# Altium schematic sheet IDC_Tester_v1_connector.SchDoc
size A4; SheetNumber: 3; SheetTotal: 10
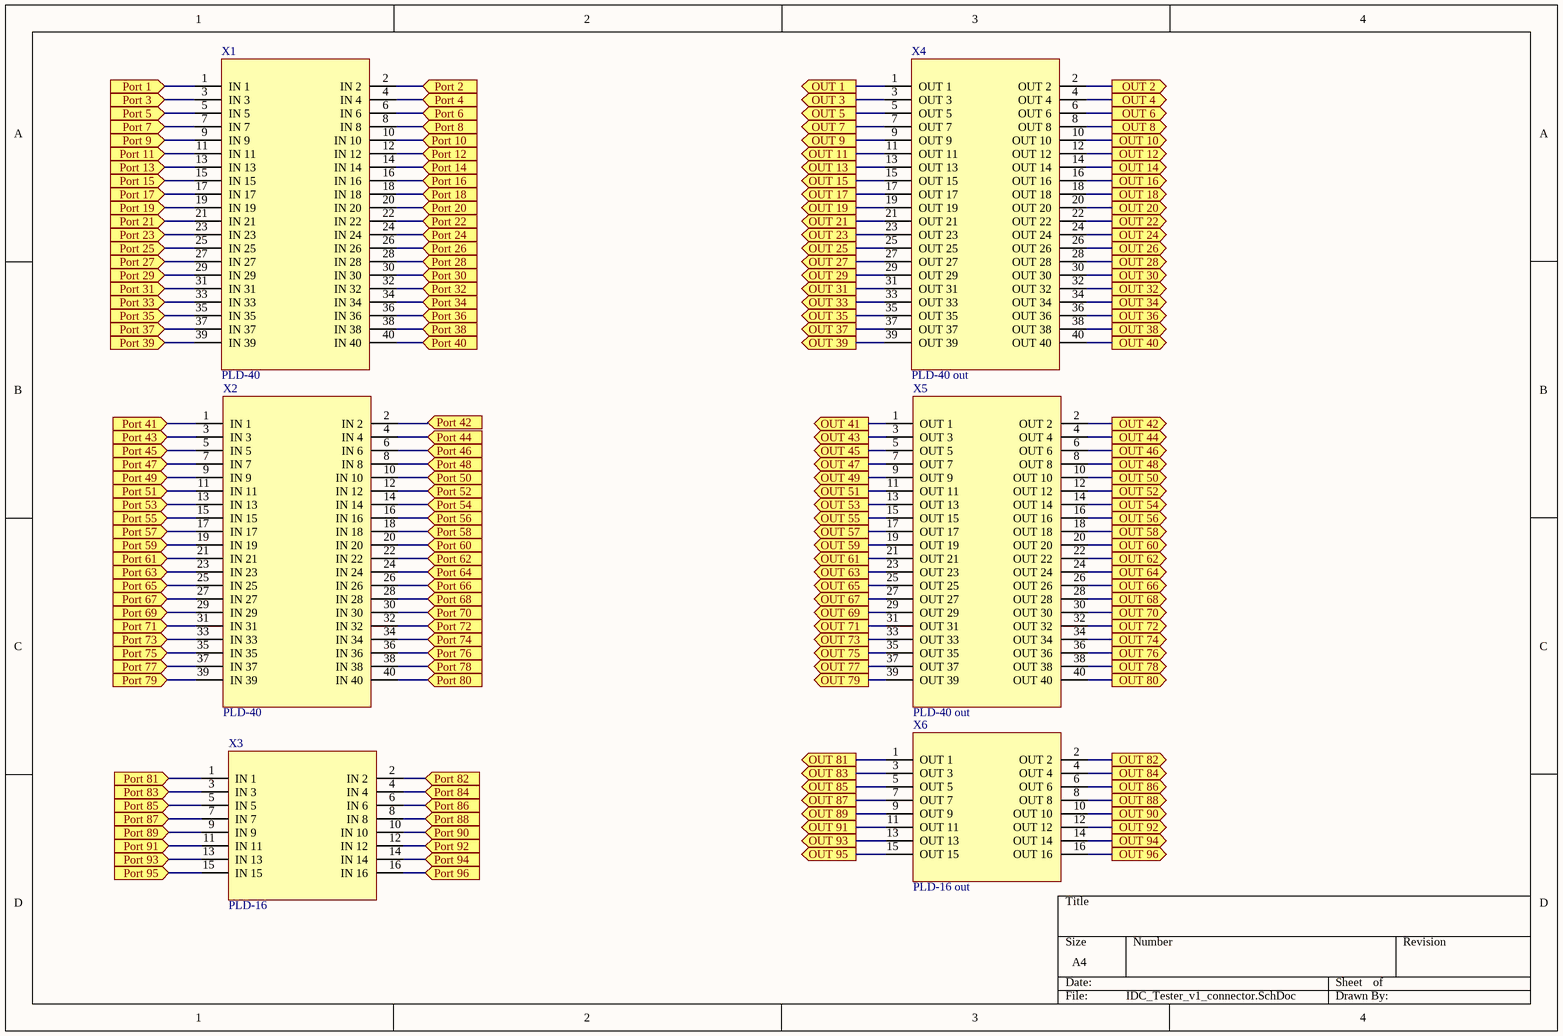
[diagram p0: IDC_Tester_v1_connector.SchDoc]

## Parts
X1  PLD-40  [PLD-40]
X2  PLD-40  [PLD-40]
X3  PLD-16  [PLD-16]
X4  PLD-40 out  [PLD-40]
X5  PLD-40 out  [PLD-40]
X6  PLD-16 out  [PLD-16]

## Ports
OUT 1 (out), OUT 2 (out), OUT 3 (out), OUT 4 (out), OUT 5 (out), OUT 6 (out), OUT 7 (out), OUT 8 (out), OUT 9 (out), OUT 10 (out), OUT 11 (out), OUT 12 (out), OUT 13 (out), OUT 14 (out), OUT 15 (out), OUT 16 (out), OUT 17 (out), OUT 18 (out), OUT 19 (out), OUT 20 (out), OUT 21 (out), OUT 22 (out), OUT 23 (out), OUT 24 (out), OUT 25 (out), OUT 26 (out), OUT 27 (out), OUT 28 (out), OUT 29 (out), OUT 30 (out), OUT 31 (out), OUT 32 (out), OUT 33 (out), OUT 34 (out), OUT 35 (out), OUT 36 (out), OUT 37 (out), OUT 38 (out), OUT 39 (out), OUT 40 (out), OUT 41 (out), OUT 42 (out), OUT 43 (out), OUT 44 (out), OUT 45 (out), OUT 46 (out), OUT 47 (out), OUT 48 (out), OUT 49 (out), OUT 50 (out), OUT 51 (out), OUT 52 (out), OUT 53 (out), OUT 54 (out), OUT 55 (out), OUT 56 (out), OUT 57 (out), OUT 58 (out), OUT 59 (out), OUT 60 (out), OUT 61 (out), OUT 62 (out), OUT 63 (out), OUT 64 (out), OUT 65 (out), OUT 66 (out), OUT 67 (out), OUT 68 (out), OUT 69 (out), OUT 70 (out), OUT 71 (out), OUT 72 (out), OUT 73 (out), OUT 74 (out), OUT 75 (out), OUT 76 (out), OUT 77 (out), OUT 78 (out), OUT 79 (out), OUT 80 (out), OUT 81 (out), OUT 82 (out), OUT 83 (out), OUT 84 (out), OUT 85 (out), OUT 86 (out), OUT 87 (out), OUT 88 (out), OUT 89 (out), OUT 90 (out), OUT 91 (out), OUT 92 (out), OUT 93 (out), OUT 94 (out), OUT 95 (out), OUT 96 (out), Port 1 (in), Port 2 (in), Port 3 (in), Port 4 (in), Port 5 (in), Port 6 (in), Port 7 (in), Port 8 (in), Port 9 (in), Port 10 (in), Port 11 (in), Port 12 (in), Port 13 (in), Port 14 (in), Port 15 (in), Port 16 (in), Port 17 (in), Port 18 (in), Port 19 (in), Port 20 (in), Port 21 (in), Port 22 (in), Port 23 (in), Port 24 (in), Port 25 (in), Port 26 (in), Port 27 (in), Port 28 (in), Port 29 (in), Port 30 (in), Port 31 (in), Port 32 (in), Port 33 (in), Port 34 (in), Port 35 (in), Port 36 (in), Port 37 (in), Port 38 (in), Port 39 (in), Port 40 (in), Port 41 (in), Port 42 (in), Port 43 (in), Port 44 (in), Port 45 (in), Port 46 (in), Port 47 (in), Port 48 (in), Port 49 (in), Port 50 (in), Port 51 (in), Port 52 (in), Port 53 (in), Port 54 (in), Port 55 (in), Port 56 (in), Port 57 (in), Port 58 (in), Port 59 (in), Port 60 (in), Port 61 (in), Port 62 (in), Port 63 (in), Port 64 (in), Port 65 (in), Port 66 (in), Port 67 (in), Port 68 (in), Port 69 (in), Port 70 (in), Port 71 (in), Port 72 (in), Port 73 (in), Port 74 (in), Port 75 (in), Port 76 (in), Port 77 (in), Port 78 (in), Port 79 (in), Port 80 (in), Port 81 (in), Port 82 (in), Port 83 (in), Port 84 (in), Port 85 (in), Port 86 (in), Port 87 (in), Port 88 (in), Port 89 (in), Port 90 (in), Port 91 (in), Port 92 (in), Port 93 (in), Port 94 (in), Port 95 (in), Port 96 (in)

## Nets
OUT 1: X4.1(OUT_1) ; port OUT 1
OUT 2: X4.2(OUT_2) ; port OUT 2
OUT 3: X4.3(OUT_3) ; port OUT 3
OUT 4: X4.4(OUT_4) ; port OUT 4
OUT 5: X4.5(OUT_5) ; port OUT 5
OUT 6: X4.6(OUT_6) ; port OUT 6
OUT 7: X4.7(OUT_7) ; port OUT 7
OUT 8: X4.8(OUT_8) ; port OUT 8
OUT 9: X4.9(OUT_9) ; port OUT 9
OUT 10: X4.10(OUT_10) ; port OUT 10
OUT 11: X4.11(OUT_11) ; port OUT 11
OUT 12: X4.12(OUT_12) ; port OUT 12
OUT 13: X4.13(OUT_13) ; port OUT 13
OUT 14: X4.14(OUT_14) ; port OUT 14
OUT 15: X4.15(OUT_15) ; port OUT 15
OUT 16: X4.16(OUT_16) ; port OUT 16
OUT 17: X4.17(OUT_17) ; port OUT 17
OUT 18: X4.18(OUT_18) ; port OUT 18
OUT 19: X4.19(OUT_19) ; port OUT 19
OUT 20: X4.20(OUT_20) ; port OUT 20
OUT 21: X4.21(OUT_21) ; port OUT 21
OUT 22: X4.22(OUT_22) ; port OUT 22
OUT 23: X4.23(OUT_23) ; port OUT 23
OUT 24: X4.24(OUT_24) ; port OUT 24
OUT 25: X4.25(OUT_25) ; port OUT 25
OUT 26: X4.26(OUT_26) ; port OUT 26
OUT 27: X4.27(OUT_27) ; port OUT 27
OUT 28: X4.28(OUT_28) ; port OUT 28
OUT 29: X4.29(OUT_29) ; port OUT 29
OUT 30: X4.30(OUT_30) ; port OUT 30
OUT 31: X4.31(OUT_31) ; port OUT 31
OUT 32: X4.32(OUT_32) ; port OUT 32
OUT 33: X4.33(OUT_33) ; port OUT 33
OUT 34: X4.34(OUT_34) ; port OUT 34
OUT 35: X4.35(OUT_35) ; port OUT 35
OUT 36: X4.36(OUT_36) ; port OUT 36
OUT 37: X4.37(OUT_37) ; port OUT 37
OUT 38: X4.38(OUT_38) ; port OUT 38
OUT 39: X4.39(OUT_39) ; port OUT 39
OUT 40: X4.40(OUT_40) ; port OUT 40
OUT 41: X5.1(OUT_1) ; port OUT 41
OUT 42: X5.2(OUT_2) ; port OUT 42
OUT 43: X5.3(OUT_3) ; port OUT 43
OUT 44: X5.4(OUT_4) ; port OUT 44
OUT 45: X5.5(OUT_5) ; port OUT 45
OUT 46: X5.6(OUT_6) ; port OUT 46
OUT 47: X5.7(OUT_7) ; port OUT 47
OUT 48: X5.8(OUT_8) ; port OUT 48
OUT 49: X5.9(OUT_9) ; port OUT 49
OUT 50: X5.10(OUT_10) ; port OUT 50
OUT 51: X5.11(OUT_11) ; port OUT 51
OUT 52: X5.12(OUT_12) ; port OUT 52
OUT 53: X5.13(OUT_13) ; port OUT 53
OUT 54: X5.14(OUT_14) ; port OUT 54
OUT 55: X5.15(OUT_15) ; port OUT 55
OUT 56: X5.16(OUT_16) ; port OUT 56
OUT 57: X5.17(OUT_17) ; port OUT 57
OUT 58: X5.18(OUT_18) ; port OUT 58
OUT 59: X5.19(OUT_19) ; port OUT 59
OUT 60: X5.20(OUT_20) ; port OUT 60
OUT 61: X5.21(OUT_21) ; port OUT 61
OUT 62: X5.22(OUT_22) ; port OUT 62
OUT 63: X5.23(OUT_23) ; port OUT 63
OUT 64: X5.24(OUT_24) ; port OUT 64
OUT 65: X5.25(OUT_25) ; port OUT 65
OUT 66: X5.26(OUT_26) ; port OUT 66
OUT 67: X5.27(OUT_27) ; port OUT 67
OUT 68: X5.28(OUT_28) ; port OUT 68
OUT 69: X5.29(OUT_29) ; port OUT 69
OUT 70: X5.30(OUT_30) ; port OUT 70
OUT 71: X5.31(OUT_31) ; port OUT 71
OUT 72: X5.32(OUT_32) ; port OUT 72
OUT 73: X5.33(OUT_33) ; port OUT 73
OUT 74: X5.34(OUT_34) ; port OUT 74
OUT 75: X5.35(OUT_35) ; port OUT 75
OUT 76: X5.36(OUT_36) ; port OUT 76
OUT 77: X5.37(OUT_37) ; port OUT 77
OUT 78: X5.38(OUT_38) ; port OUT 78
OUT 79: X5.39(OUT_39) ; port OUT 79
OUT 80: X5.40(OUT_40) ; port OUT 80
OUT 81: X6.1(OUT_1) ; port OUT 81
OUT 82: X6.2(OUT_2) ; port OUT 82
OUT 83: X6.3(OUT_3) ; port OUT 83
OUT 84: X6.4(OUT_4) ; port OUT 84
OUT 85: X6.5(OUT_5) ; port OUT 85
OUT 86: X6.6(OUT_6) ; port OUT 86
OUT 87: X6.7(OUT_7) ; port OUT 87
OUT 88: X6.8(OUT_8) ; port OUT 88
OUT 89: X6.9(OUT_9) ; port OUT 89
OUT 90: X6.10(OUT_10) ; port OUT 90
OUT 91: X6.11(OUT_11) ; port OUT 91
OUT 92: X6.12(OUT_12) ; port OUT 92
OUT 93: X6.13(OUT_13) ; port OUT 93
OUT 94: X6.14(OUT_14) ; port OUT 94
OUT 95: X6.15(OUT_15) ; port OUT 95
OUT 96: X6.16(OUT_16) ; port OUT 96
Port 1: X1.1(IN_1) ; port Port 1
Port 2: X1.2(IN_2) ; port Port 2
Port 3: X1.3(IN_3) ; port Port 3
Port 4: X1.4(IN_4) ; port Port 4
Port 5: X1.5(IN_5) ; port Port 5
Port 6: X1.6(IN_6) ; port Port 6
Port 7: X1.7(IN_7) ; port Port 7
Port 8: X1.8(IN_8) ; port Port 8
Port 9: X1.9(IN_9) ; port Port 9
Port 10: X1.10(IN_10) ; port Port 10
Port 11: X1.11(IN_11) ; port Port 11
Port 12: X1.12(IN_12) ; port Port 12
Port 13: X1.13(IN_13) ; port Port 13
Port 14: X1.14(IN_14) ; port Port 14
Port 15: X1.15(IN_15) ; port Port 15
Port 16: X1.16(IN_16) ; port Port 16
Port 17: X1.17(IN_17) ; port Port 17
Port 18: X1.18(IN_18) ; port Port 18
Port 19: X1.19(IN_19) ; port Port 19
Port 20: X1.20(IN_20) ; port Port 20
Port 21: X1.21(IN_21) ; port Port 21
Port 22: X1.22(IN_22) ; port Port 22
Port 23: X1.23(IN_23) ; port Port 23
Port 24: X1.24(IN_24) ; port Port 24
Port 25: X1.25(IN_25) ; port Port 25
Port 26: X1.26(IN_26) ; port Port 26
Port 27: X1.27(IN_27) ; port Port 27
Port 28: X1.28(IN_28) ; port Port 28
Port 29: X1.29(IN_29) ; port Port 29
Port 30: X1.30(IN_30) ; port Port 30
Port 31: X1.31(IN_31) ; port Port 31
Port 32: X1.32(IN_32) ; port Port 32
Port 33: X1.33(IN_33) ; port Port 33
Port 34: X1.34(IN_34) ; port Port 34
Port 35: X1.35(IN_35) ; port Port 35
Port 36: X1.36(IN_36) ; port Port 36
Port 37: X1.37(IN_37) ; port Port 37
Port 38: X1.38(IN_38) ; port Port 38
Port 39: X1.39(IN_39) ; port Port 39
Port 40: X1.40(IN_40) ; port Port 40
Port 41: X2.1(IN_1) ; port Port 41
Port 42: X2.2(IN_2) ; port Port 42
Port 43: X2.3(IN_3) ; port Port 43
Port 44: X2.4(IN_4) ; port Port 44
Port 45: X2.5(IN_5) ; port Port 45
Port 46: X2.6(IN_6) ; port Port 46
Port 47: X2.7(IN_7) ; port Port 47
Port 48: X2.8(IN_8) ; port Port 48
Port 49: X2.9(IN_9) ; port Port 49
Port 50: X2.10(IN_10) ; port Port 50
Port 51: X2.11(IN_11) ; port Port 51
Port 52: X2.12(IN_12) ; port Port 52
Port 53: X2.13(IN_13) ; port Port 53
Port 54: X2.14(IN_14) ; port Port 54
Port 55: X2.15(IN_15) ; port Port 55
Port 56: X2.16(IN_16) ; port Port 56
Port 57: X2.17(IN_17) ; port Port 57
Port 58: X2.18(IN_18) ; port Port 58
Port 59: X2.19(IN_19) ; port Port 59
Port 60: X2.20(IN_20) ; port Port 60
Port 61: X2.21(IN_21) ; port Port 61
Port 62: X2.22(IN_22) ; port Port 62
Port 63: X2.23(IN_23) ; port Port 63
Port 64: X2.24(IN_24) ; port Port 64
Port 65: X2.25(IN_25) ; port Port 65
Port 66: X2.26(IN_26) ; port Port 66
Port 67: X2.27(IN_27) ; port Port 67
Port 68: X2.28(IN_28) ; port Port 68
Port 69: X2.29(IN_29) ; port Port 69
Port 70: X2.30(IN_30) ; port Port 70
Port 71: X2.31(IN_31) ; port Port 71
Port 72: X2.32(IN_32) ; port Port 72
Port 73: X2.33(IN_33) ; port Port 73
Port 74: X2.34(IN_34) ; port Port 74
Port 75: X2.35(IN_35) ; port Port 75
Port 76: X2.36(IN_36) ; port Port 76
Port 77: X2.37(IN_37) ; port Port 77
Port 78: X2.38(IN_38) ; port Port 78
Port 79: X2.39(IN_39) ; port Port 79
Port 80: X2.40(IN_40) ; port Port 80
Port 81: X3.1(IN_1) ; port Port 81
Port 82: X3.2(IN_2) ; port Port 82
Port 83: X3.3(IN_3) ; port Port 83
Port 84: X3.4(IN_4) ; port Port 84
Port 85: X3.5(IN_5) ; port Port 85
Port 86: X3.6(IN_6) ; port Port 86
Port 87: X3.7(IN_7) ; port Port 87
Port 88: X3.8(IN_8) ; port Port 88
Port 89: X3.9(IN_9) ; port Port 89
Port 90: X3.10(IN_10) ; port Port 90
Port 91: X3.11(IN_11) ; port Port 91
Port 92: X3.12(IN_12) ; port Port 92
Port 93: X3.13(IN_13) ; port Port 93
Port 94: X3.14(IN_14) ; port Port 94
Port 95: X3.15(IN_15) ; port Port 95
Port 96: X3.16(IN_16) ; port Port 96

## Library data of the parts
X1 X2 = PLD-40: Part Number: DS1021-2x20; Added by: viskov2055@gmail.com; Mount_Type: THM; Solder_Amount: 40; Created at: 13/02/2024; Mount: MOUNT; Pkg: PLD-40
X3 = PLD-16: Part Number: DS1021-2x8; Added by: viskov2055@gmail.com; Mount_Type: THM; Solder_Amount: 16; Created at: 13/02/2024; Mount: MOUNT; Pkg: PLD-16
X4 X5 = PLD-40 out: Part Number: DS1021-2x20; Added by: viskov2055@gmail.com; Mount_Type: THM; Solder_Amount: 40; Created at: 16/02/2024; Mount: MOUNT; Pkg: PLD-40
X6 = PLD-16 out: Part Number: DS1021-2x8; Added by: viskov2055@gmail.com; Mount_Type: THM; Solder_Amount: 16; Created at: 16/02/2024; Mount: MOUNT; Pkg: PLD-16